# Altium schematic sheet ST1L08_5V_0V6.SchDoc
size A3
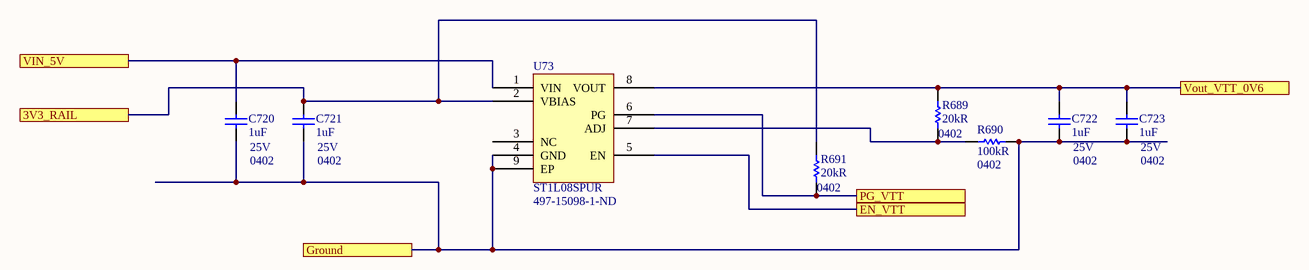
[diagram p0: ST1L08_5V_0V6.SchDoc]

## Parts
C720  1uF  Case/Package: 0402  Voltage Rating: 25V  [CAP 0402/1005 KK]
C721  1uF  Case/Package: 0402  Voltage Rating: 25V  [CAP 0402/1005 KK]
C722  1uF  Case/Package: 0402  Voltage Rating: 25V  [CAP 0402/1005 KK]
C723  1uF  Case/Package: 0402  Voltage Rating: 25V  [CAP 0402/1005 KK]
R689  20kR  Case/Package: 0402  [RES 0402/1005 RF KK]
R690  100kR  Case/Package: 0402  [RES 0402/1005 RF KK]
R691  20kR  Case/Package: 0402  [RES 0402/1005 RF KK]
U73  ST1L08SPUR  Supplier Part Number 1: 497-15098-1-ND  [ST1L08]

## Ports
3V3_RAIL, EN_VTT, Ground, PG_VTT, VIN_5V, Vout_VTT_0V6

## Nets
3V3_RAIL: C721.2 R691.1 U73.2(VBIAS) ; port 3V3_RAIL
EN_VTT: U73.5(EN) ; port EN_VTT
Ground: C720.1 C721.1 C722.1 C723.1 R690.1 U73.4(GND) U73.9(EP) ; port Ground
PG_VTT: R691.2 U73.6(PG) ; port PG_VTT
VIN_5V: C720.2 U73.1(VIN) ; port VIN_5V
Vout_VTT_0V6: C722.2 C723.2 R689.1 U73.8(VOUT) ; port Vout_VTT_0V6
NetR689_2: R689.2 R690.2 U73.7(ADJ)

Not connected (* = marked no-connect by the designer): U73 3(NC)

## Notes on the sheet
- Title
- Size:
- Date:
- A3
- Number:
- Time:
- Revision:
- Sheet
- of
- File:

## Library data of the parts
C720-C723 = Capacitor: MURATA - GRT155R61E105KE01D - SMD Multilayer Ceramic Capacitor, 1 µF, 25 V, 0402 [1005 Metric], ± 10%, X5R, GRT Series - SMD Multilayer Ceramic Capacitor, 1 µF, 25 V, 0402 [1005 Metric], ± 10%, X5R, GRT Series; Supplier 1: Digi-Key; Supplier Part Number 1: 490-12263-1-ND; Manufacturer: Murata; Manufacturer Part Number: GRT155R61E105KE01D; RoHS: Yes; Category: Ceramic Capacitors; Stock 1: 341453; Pricing 1: 1=0,18000, 10=0,12300, 100=0,06210, 500=0,04248, 1000=0,03758, 2500=0,03594, 5000=0,03268 (USD); Mount: Surface Mount; Case Code (Metric): 1005; Case Code (Imperial): 0402; Min Operating Temperature: -55°C; Max Operating Temperature: 85°C; Packaging: Tape and Reel; Capacitance: 1uF; Tolerance: 10%; Dielectric: X5R; Voltage Rating (DC): 25V; Length: 0.039inch; Width: 0.02inch; Thickness: 0.022inch; Ratings: AEC-Q200; ComponentLink1URL: http://www.farnell.com/datasheets/2165918.pdf?src-supplier=Farnell; ComponentLink1Description: http://www.farnell.com/datasheets/2165918.pdf?src-supplier=Farnell; ComponentLink2URL: http://search.murata.co.jp/Ceramy/image/img/A01X/G101/ENG/GRT155R61E105KE01-01.pdf?src-supplier=Digi-Key; ComponentLink2Description: http://search.murata.co.jp/Ceramy/image/img/A01X/G101/ENG/GRT155R61E105KE01-01.pdf?src-supplier=Digi-Key; ComponentLink3URL: http://www.farnell.com/datasheets/2165918.pdf?src-supplier=Element14; ComponentLink3Description: http://www.farnell.com/datasheets/2165918.pdf?src-supplier=Element14
R689 R691 = Resistor: Manufacturer: Panasonic; Manufacturer Part Number: ERJ-2RKF2002X; Power Rating: 100mW; Tolerance: 1%; Voltage Rating: 50V; Temperature Coefficient: 100ppm/°C; Supplier 1: Digi-Key; Supplier Part Number 1: P20.0KLCT-ND; Stock 1: 2516725; Pricing 1: 1 = 0,10000, 10 = 0,05000, 100 = 0,02050, 1000 = 0,00920, 2500 = 0,00798, 5000 = 0,00660 (USD); RoHS: Yes; Mount: Surface Mount; Weight: 2.8E-05oz; Case Code (Metric): 1005; Case Code (Imperial): 0402; Contact Plating: Tin; Min Operating Temperature: -55°C; Max Operating Temperature: 155°C; Resistance: 20kR; Packaging: Cut Tape; Package Quantity: 1; Composition: Thick Film; Number of Terminations: 2; Termination: SMD/SMT; Military Standard: Not; Max Power Dissipation: 100mW; Voltage Rating (DC): 50V; Features: Automotive AEC-Q200; Length: 1mm; Height: 0.35mm; Width: 0.02inch; Depth: 0.5mm; Radiation Hardening: No; REACH SVHC: No SVHC; Lead Free: Lead Free; ComponentLink1URL: https://datasheet.ciiva.com/11821/0900766b80f80784-11821220.pdf?src-supplier=RSComponents; ComponentLink1Description: https://datasheet.ciiva.com/11821/0900766b80f80784-11821220.pdf?src-supplier=RSComponents; ComponentLink2URL: https://datasheet.ciiva.com/16762/70260748-16762885.pdf?src-supplier=Allied+Electronics; ComponentLink2Description: https://datasheet.ciiva.com/16762/70260748-16762885.pdf?src-supplier=Allied+Electronics; ComponentLink3URL: https://datasheet.ciiva.com/16782/70260748-16782455.pdf?src-supplier=Allied+Electronics; ComponentLink3Description: https://datasheet.ciiva.com/16782/70260748-16782455.pdf?src-supplier=Allied+Electronics; ComponentLink4URL: https://datasheet.ciiva.com/48531/aoa0000ce2-48531063.pdf?src-supplier=Avnet; ComponentLink4Description: https://datasheet.ciiva.com/48531/aoa0000ce2-48531063.pdf?src-supplier=Avnet; ComponentLink5URL: https://datasheet.ciiva.com/28688/1678782-28688600.pdf?src-supplier=Element14; ComponentLink5Description: https://datasheet.ciiva.com/28688/1678782-28688600.pdf?src-supplier=Element14; ComponentLink6URL: https://datasheet.ciiva.com/46377/426256-46377368.pdf?src-supplier=Element14; ComponentLink6Description: https://datasheet.ciiva.com/46377/426256-46377368.pdf?src-supplier=Element14; ComponentLink7URL: https://datasheet.ciiva.com/6138/426256-6138761.pdf?src-supplier=Farnell; ComponentLink7Description: https://datasheet.ciiva.com/6138/426256-6138761.pdf?src-supplier=Farnell; ComponentLink8URL: https://datasheet.ciiva.com/24159/aoa0000ce2-24159274.pdf?src-supplier=Mouser; ComponentLink8Description: https://datasheet.ciiva.com/24159/aoa0000ce2-24159274.pdf?src-supplier=Mouser; ComponentLink9URL: https://datasheet.ciiva.com/16508/aoa0000ce2-16508524.pdf?src-supplier=Future+Electronics; ComponentLink9Description: https://datasheet.ciiva.com/16508/aoa0000ce2-16508524.pdf?src-supplier=Future+Electronics; ComponentLink10URL: https://datasheet.ciiva.com/16514/aoa0000ce2-16514269.pdf?src-supplier=Avnet+Asia; ComponentLink10Description: https://datasheet.ciiva.com/16514/aoa0000ce2-16514269.pdf?src-supplier=Avnet+Asia; ComponentLink11URL: https://datasheet.ciiva.com/30049/aoa0000ce2-30049982.pdf?src-supplier=Onlinecomponents.com; ComponentLink11Description: https://datasheet.ciiva.com/30049/aoa0000ce2-30049982.pdf?src-supplier=Onlinecomponents.com
R690 = Resistor: Manufacturer 1: Panasonic; Manufacturer Part Number 1: ERA-2AED104X; Tolerance: 0.5%; Power Rating: 63mW; Voltage Rating: 25V; Temperature Coefficient: 25ppm/°C; Supplier 1: Digi-Key; Supplier Part Number 1: P100KDECT-ND; Stock 1: 54338; Pricing 1: 1=0.22000, 10=0.18800, 100=0.07350, 1000=0.03077, 2500=0.02820, 5000=0.02564 (USD); RoHS: Yes; Mount: Surface Mount; Case Code (Imperial): 0402; Case Code (Metric): 1005; Contact Plating: Tin; Min Operating Temperature: -55°C; Max Operating Temperature: 155°C; Resistance: 100kR; Packaging: Tape and Reel; Package Quantity: 10000; Composition: Metal Film,Thin Film; Number of Terminations: 2; Military Standard: Not; Termination: SMD/SMT; Max Power Dissipation: 63mW; Voltage Rating (DC): 25V; Length: 1mm; Height: 0.016inch; Width: 0.5mm; Depth: 0.5mm; Radiation Hardening: No; REACH SVHC: No SVHC; Lead Free: Lead Free; ComponentLink1URL: https://datasheet.ciiva.com/24028/aoa0000ce26-197354-24028150.pdf?src-supplier=Mouser; ComponentLink1Description: https://datasheet.ciiva.com/24028/aoa0000ce26-197354-24028150.pdf?src-supplier=Mouser; ComponentLink2URL: https://datasheet.ciiva.com/43470/1776116-43470438.pdf?src-supplier=Farnell; ComponentLink2Description: https://datasheet.ciiva.com/43470/1776116-43470438.pdf?src-supplier=Farnell; ComponentLink3URL: https://datasheet.ciiva.com/7830/1776116-7830920.pdf?src-supplier=Element14; ComponentLink3Description: https://datasheet.ciiva.com/7830/1776116-7830920.pdf?src-supplier=Element14; ComponentLink4URL: https://datasheet.ciiva.com/46378/1776116-46378234.pdf?src-supplier=Element14; ComponentLink4Description: https://datasheet.ciiva.com/46378/1776116-46378234.pdf?src-supplier=Element14; ComponentLink5URL: https://datasheet.ciiva.com/16780/70068849-16780139.pdf?src-supplier=Allied+Electronics; ComponentLink5Description: https://datasheet.ciiva.com/16780/70068849-16780139.pdf?src-supplier=Allied+Electronics; ComponentLink6URL: https://datasheet.ciiva.com/9117/aoa0000ce26-9117229.pdf?src-supplier=Avnet; ComponentLink6Description: https://datasheet.ciiva.com/9117/aoa0000ce26-9117229.pdf?src-supplier=Avnet; ComponentLink7URL: https://datasheet.ciiva.com/16511/aoa0000ce26-16511566.pdf?src-supplier=Avnet+Asia; ComponentLink7Description: https://datasheet.ciiva.com/16511/aoa0000ce26-16511566.pdf?src-supplier=Avnet+Asia; ComponentLink8URL: https://datasheet.ciiva.com/30225/54aoa0000ce26-30225311.pdf?src-supplier=Onlinecomponents.com; ComponentLink8Description: https://datasheet.ciiva.com/30225/54aoa0000ce26-30225311.pdf?src-supplier=Onlinecomponents.com
U73 = ST1L08SPUR: IC REG LINEAR POS ADJ 800MA 8DFN; Manufacturer: STMicroelectronics; Number of Outputs: 1; Min Input Voltage: 1V; Max Input Voltage: 5.5V; Output Voltage: 4V; Dropout Voltage: 700mV; Polarity: Positive; Accuracy: 2%; Quiescent Current: 150uA; Operating Supply Current: 200nA; Power Supply Rejection Ratio (PSRR): 80dB; Output Type: Adjustable; Supplier 1: Digi-Key; Manufacturer Part Number: ST1L08SPUR; Stock 1: 4850; Pricing 1: 1 = 0,72000, 10 = 0,63200, 25 = 0,59400, 100 = 0,45020, 250 = 0,38316, 500 = 0,36400, 1000 = 0,27779 (USD); RoHS: Yes; Mount: Surface Mount; Case/Package: DFN; Number of Pins: 8; Min Operating Temperature: -40°C; Max Operating Temperature: 125°C; Packaging: Tape and Reel; Max Output Current: 800mA; Output Current: 800mA; Number of Regulators: 1; Input Bias Current: 150uA; Package Quantity: 2500; Tolerance: 2%; Length: 2mm; Height: 0.9mm; Width: 3mm; Radiation Hardening: No; Lead Free: Lead Free; ComponentLink1URL: https://datasheet.ciiva.com/48677/dm00123507-48677501.pdf?src-supplier=Avnet; ComponentLink1Description: https://datasheet.ciiva.com/48677/dm00123507-48677501.pdf?src-supplier=Avnet